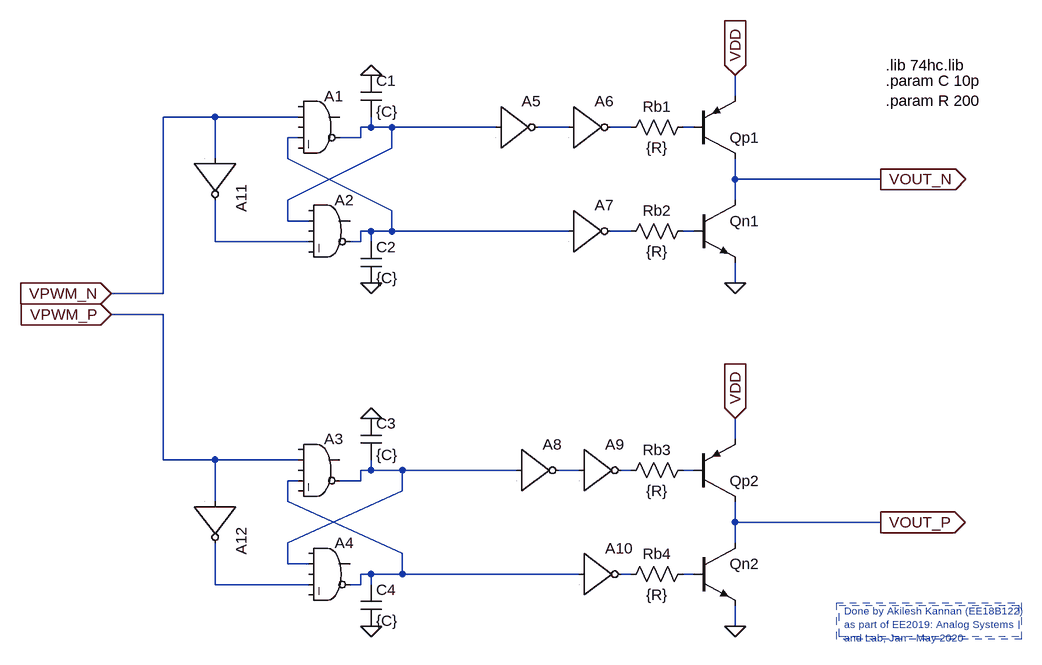
[diagram p0: schematic exp5-block.asc]
exp5-block.asc, the LTspice schematic file:
Version 4
SHEET 1 1596 696
WIRE 800 -144 800 -176
WIRE 0 -112 -80 -112
WIRE 128 -112 0 -112
WIRE 240 -96 240 -112
WIRE 240 -96 224 -96
WIRE 272 -96 240 -96
WIRE 432 -96 272 -96
WIRE 544 -96 496 -96
WIRE 640 -96 608 -96
WIRE 736 -96 720 -96
WIRE 128 -80 112 -80
WIRE 224 -80 224 -96
WIRE 224 -80 192 -80
WIRE 272 -64 272 -96
WIRE 0 -48 0 -112
WIRE 112 -48 112 -80
WIRE 800 -16 800 -48
WIRE 1024 -16 800 -16
WIRE 112 16 272 -64
WIRE 800 16 800 -16
WIRE 272 32 112 -48
WIRE 112 48 112 16
WIRE 144 48 112 48
WIRE 240 64 224 64
WIRE 272 64 272 32
WIRE 272 64 240 64
WIRE 544 64 272 64
WIRE 640 64 608 64
WIRE 736 64 720 64
WIRE 0 80 0 16
WIRE 144 80 0 80
WIRE 224 80 224 64
WIRE 224 80 208 80
WIRE 240 80 240 64
WIRE 800 144 800 112
WIRE -80 160 -80 -112
WIRE -80 160 -160 160
WIRE -80 192 -160 192
WIRE 800 384 800 352
WIRE -80 416 -80 192
WIRE 0 416 -80 416
WIRE 128 416 0 416
WIRE 240 432 240 416
WIRE 240 432 224 432
WIRE 288 432 240 432
WIRE 464 432 288 432
WIRE 560 432 528 432
WIRE 640 432 624 432
WIRE 736 432 720 432
WIRE 128 448 112 448
WIRE 224 448 224 432
WIRE 224 448 192 448
WIRE 288 464 288 432
WIRE 0 480 0 416
WIRE 112 480 112 448
WIRE 800 512 800 480
WIRE 1024 512 800 512
WIRE 112 544 288 464
WIRE 800 544 800 512
WIRE 288 560 112 480
WIRE 112 576 112 544
WIRE 144 576 112 576
WIRE 240 592 224 592
WIRE 288 592 288 560
WIRE 288 592 240 592
WIRE 560 592 288 592
WIRE 640 592 624 592
WIRE 736 592 720 592
WIRE 0 608 0 544
WIRE 144 608 0 608
WIRE 224 608 224 592
WIRE 224 608 208 608
WIRE 240 608 240 592
WIRE 800 672 800 640
FLAG 800 144 0
FLAG 800 -176 VDD
IOPIN 800 -176 In
FLAG 800 672 0
FLAG 800 352 VDD
IOPIN 800 352 In
FLAG 240 672 0
FLAG 240 352 0
FLAG 240 -176 0
FLAG 240 144 0
FLAG -160 160 VPWM_N
IOPIN -160 160 In
FLAG -160 192 VPWM_P
IOPIN -160 192 In
FLAG 1024 -16 VOUT_N
IOPIN 1024 -16 Out
FLAG 1024 512 VOUT_P
IOPIN 1024 512 Out
SYMBOL res 736 -112 R90
WINDOW 0 0 56 VBottom 2
WINDOW 3 32 56 VTop 2
SYMATTR InstName Rb1
SYMATTR Value {R}
SYMBOL res 736 48 R90
WINDOW 0 0 56 VBottom 2
WINDOW 3 32 56 VTop 2
SYMATTR InstName Rb2
SYMATTR Value {R}
SYMBOL pnp 736 -48 M180
WINDOW 3 84 68 Invisible 2
SYMATTR Value BC179A
SYMATTR InstName Qp1
SYMBOL npn 736 16 R0
WINDOW 3 56 68 Invisible 2
SYMATTR Value BC107B
SYMATTR InstName Qn1
SYMBOL res 736 416 R90
WINDOW 0 0 56 VBottom 2
WINDOW 3 32 56 VTop 2
SYMATTR InstName Rb3
SYMATTR Value {R}
SYMBOL res 736 576 R90
WINDOW 0 0 56 VBottom 2
WINDOW 3 32 56 VTop 2
SYMATTR InstName Rb4
SYMATTR Value {R}
SYMBOL pnp 736 480 M180
WINDOW 3 84 68 Invisible 2
SYMATTR Value BC179A
SYMATTR InstName Qp2
SYMBOL npn 736 544 R0
WINDOW 3 56 68 Invisible 2
SYMATTR Value BC107B
SYMATTR InstName Qn2
SYMBOL cap 224 -176 R0
SYMATTR InstName C1
SYMATTR Value {C}
SYMBOL cap 224 80 R0
SYMATTR InstName C2
SYMATTR Value {C}
SYMBOL cap 224 352 R0
SYMATTR InstName C3
SYMATTR Value {C}
SYMBOL cap 224 608 R0
SYMATTR InstName C4
SYMATTR Value {C}
SYMBOL Digital/and 160 -160 R0
WINDOW 3 16 46 Invisible 2
SYMATTR Value Vhigh=5 Vlow=0
SYMATTR InstName A1
SYMATTR Value2 Trise=1p Tfall=1p Td=1p
SYMBOL Digital/and 176 0 R0
WINDOW 3 16 46 Invisible 2
SYMATTR Value Vhigh=5 Vlow=0
SYMATTR InstName A2
SYMATTR Value2 Trise=1p Tfall=1p Td=1p
SYMBOL Digital/and 160 368 R0
WINDOW 3 16 112 Invisible 2
SYMATTR Value Vhigh=5 Vlow=0
SYMATTR InstName A3
SYMATTR Value2 Trise=1p Tfall=1p Td=1p
SYMBOL Digital/and 176 528 R0
WINDOW 3 16 112 Invisible 2
SYMATTR Value Vhigh=5 Vlow=0
SYMATTR InstName A4
SYMATTR Value2 Trise=1p Tfall=1p Td=1p
SYMBOL inv 432 -160 R0
WINDOW 3 0 0 Invisible 0
SYMATTR Value Vhigh=5 Vlow=0
SYMATTR InstName A5
SYMATTR Value2 Trise=1p Tfall=1p Td=1p
SYMBOL inv 544 -160 R0
WINDOW 3 0 0 Invisible 0
SYMATTR Value Vhigh=5 Vlow=0
SYMATTR InstName A6
SYMATTR Value2 Trise=1p Tfall=1p Td=1p
SYMBOL inv 544 0 R0
WINDOW 3 0 0 Invisible 0
SYMATTR Value Vhigh=5 Vlow=0
SYMATTR InstName A7
SYMATTR Value2 Trise=1p Tfall=1p Td=1p
SYMBOL inv 464 368 R0
WINDOW 3 0 0 Invisible 0
SYMATTR Value Vhigh=5 Vlow=0
SYMATTR InstName A8
SYMATTR Value2 Trise=1p Tfall=1p Td=1p
SYMBOL inv 560 368 R0
WINDOW 3 0 0 Invisible 0
SYMATTR Value Vhigh=5 Vlow=0
SYMATTR InstName A9
SYMATTR Value2 Trise=1p Tfall=1p Td=1p
SYMBOL inv 560 528 R0
WINDOW 3 0 0 Invisible 0
SYMATTR Value Vhigh=5 Vlow=0
SYMATTR InstName A10
SYMATTR Value2 Trise=1p Tfall=1p Td=1p
SYMBOL inv 64 -48 R90
WINDOW 3 0 0 Invisible 0
SYMATTR Value Vhigh=5 Vlow=0
SYMATTR InstName A11
SYMATTR Value2 Trise=1p Tfall=1p Td=1p
SYMBOL inv 64 480 R90
WINDOW 3 0 0 Invisible 0
SYMATTR Value Vhigh=5 Vlow=0
SYMATTR InstName A12
SYMATTR Value2 Trise=1p Tfall=1p Td=1p
TEXT 968 648 Left 1 ;Done by Akilesh Kannan (EE18B122) \nas part of EE2019: Analog Systems \nand Lab, Jan - May 2020
TEXT 1032 -192 Left 2 !.lib 74hc.lib
TEXT 1032 -168 Left 2 !.param C 10p\n.param R 200
RECTANGLE Normal 960 640 1236 688 3
RECTANGLE Normal 956 636 1240 692 3

The netlist it stands for:
* exp5-block.asc
Rb1 N004 N003 {R}
Rb2 N007 N006 {R}
Qp1 VOUT_N N004 VDD 0 BC179A
Qn1 VOUT_N N007 0 0 BC107B
Rb3 N012 N011 {R}
Rb4 N015 N014 {R}
Qp2 VOUT_P N012 VDD 0 BC179A
Qn2 VOUT_P N015 0 0 BC107B
C1 0 N001 {C}
C2 N005 0 {C}
C3 0 N009 {C}
C4 N013 0 {C}
A1 0 VPWM_N 0 N005 0 N001 0 0 AND Vhigh=5 Vlow=0 Trise=1p Tfall=1p Td=1p
A2 0 N001 0 N008 0 N005 0 0 AND Vhigh=5 Vlow=0 Trise=1p Tfall=1p Td=1p
A3 0 VPWM_P 0 N013 0 N009 0 0 AND Vhigh=5 Vlow=0 Trise=1p Tfall=1p Td=1p
A4 0 N009 0 N016 0 N013 0 0 AND Vhigh=5 Vlow=0 Trise=1p Tfall=1p Td=1p
A5 N001 0 0 0 0 N002 0 0 BUF Vhigh=5 Vlow=0 Trise=1p Tfall=1p Td=1p
A6 N002 0 0 0 0 N003 0 0 BUF Vhigh=5 Vlow=0 Trise=1p Tfall=1p Td=1p
A7 N005 0 0 0 0 N006 0 0 BUF Vhigh=5 Vlow=0 Trise=1p Tfall=1p Td=1p
A8 N009 0 0 0 0 N010 0 0 BUF Vhigh=5 Vlow=0 Trise=1p Tfall=1p Td=1p
A9 N010 0 0 0 0 N011 0 0 BUF Vhigh=5 Vlow=0 Trise=1p Tfall=1p Td=1p
A10 N013 0 0 0 0 N014 0 0 BUF Vhigh=5 Vlow=0 Trise=1p Tfall=1p Td=1p
A11 VPWM_N 0 0 0 0 N008 0 0 BUF Vhigh=5 Vlow=0 Trise=1p Tfall=1p Td=1p
A12 VPWM_P 0 0 0 0 N016 0 0 BUF Vhigh=5 Vlow=0 Trise=1p Tfall=1p Td=1p
.model NPN NPN
.model PNP PNP
.lib standard.bjt
* Done by Akilesh Kannan (EE18B122)
* as part of EE2019: Analog Systems
* and Lab, Jan - May 2020
.lib 74hc.lib
.param C 10p
.param R 200
.backanno
.end